# Altium project light.PrjPcb
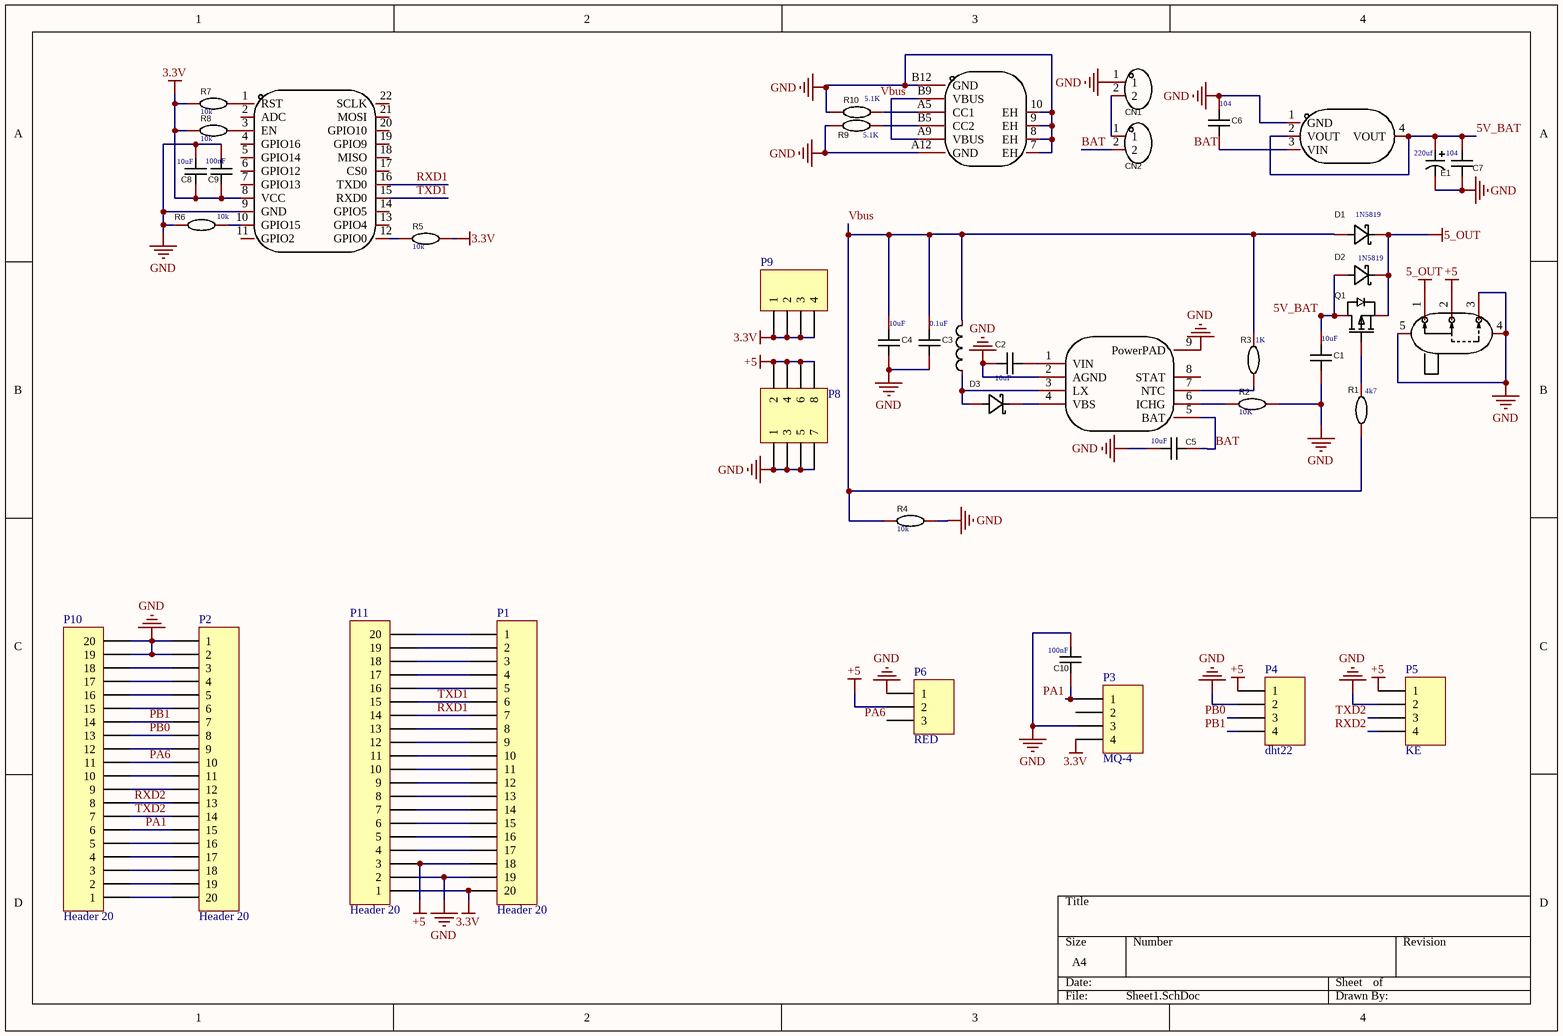
[diagram p0: Sheet1.SchDoc]
1 sheet, 43 parts. Net scope: global (net labels, ports and power ports of the same name join across sheets).
Board file: PCB1.PcbDoc

## Sheet Sheet1.SchDoc
size A4

### Parts
C1  10uF  [C0402]
C2  10uF  [C0402]
C3  0.1uF  [C0402]
C4  10uF  [C0402]
C5  10uF  [C0402]
C6  104  [C0402]
C7  104  [C0402]
C8  10uF  [C0402]
C9  100nF  [C0402]
C10  100nF  [C0402]
CN1  ZX-XH2.54-2PZZ  [CONN-TH_2P-P2.50_HX25003-2A]  (value not drawn)
CN2  ZX-XH2.54-2PZZ  [CONN-TH_2P-P2.50_HX25003-2A]  (value not drawn)
D1  1N5819  [SOD-323_L1.6-W1.3-LS2.7-RD]
D2  1N5819  [SOD-323_L1.6-W1.3-LS2.7-RD]
D3  1N5819WS S4_C2927280  [SOD-323_L1.6-W1.3-LS2.7-RD]  (value not drawn)
E1  220uf  [CAP-SMD_BD6.3-L6.6-W6.6-FD]
E3  XR0630-100M  [IND-SMD_L7.0-W6.6]  (value not drawn)
P1  Header 20  [HDR1X20]
P2  Header 20  [HDR1X20]
P3  MQ-4  [HDR1X4]
P4  dht22  [HDR1X4]
P5  KE  [HDR1X4]
P6  RED  [HDR1X3]
P8  Header 4X2  [HDR2X4]  (value not drawn)
P9  Header 4  [HDR1X4]  (value not drawn)
P10  Header 20  [HDR1X20]
P11  Header 20  [HDR1X20]
Q1  AO3401A_C15127  [SOT-23_L2.9-W1.3-P1.90-LS2.4-BR]  (value not drawn)
R1  4k7  [R0402]
R2  10K  [R0402]
R3  1K  [R0402]
R4  10k  [R0402]
R5  10k  [R0402]
R6  10k  [R0402]
R7  10k  [R0402]
R8  10k  [R0402]
R9  5.1K  [R0402]
R10  5.1K  [R0402]
U1  TPS5430DDAR  [ESOP-8_L4.9-W3.9-P1.27-LS6.0-TL-EP]  (value not drawn)
U3  AMS1117-5.0_C6187  [SOT-223_L6.5-W3.5-P2.30-LS7.0-BR]  (value not drawn)
U4  ESP-12F(ESP8266MOD)  [WIFIM-SMD_ESP-12F-ESP8266MOD]  (value not drawn)
USB1  U262-061N-4BVC11  [USB-SMD_U262-061N-4BVC11]  (value not drawn)
开关  SS-12F23-G4  [SW-TH_SS-12F23-G040]  (value not drawn)

### Nets
3.3V: C8.1 C9.1 P1.20 P3.4 P9.1 P9.2 P9.3 P9.4 P11.1 R5.1 R7.2 R8.2 U4.8(VCC)
5_OUT: D1.1(C) D2.1(C) Q1.2(S) 开关.1
+5: P1.18 P4.1 P5.1 P6.2 P8.2 P8.4 P8.6 P8.8 P11.3 开关.2
GND: C1.1 C2.2 C3.1 C4.1 C5.2 C6.2 C7.1 C8.2 C9.2 C10.2 CN1.1 E1.2 P1.19 P2.1 P2.2 P3.3 P4.2 P5.2 P6.1 P8.1 P8.3 P8.5 P8.7 P10.19 P10.20 P11.2 R2.1 R4.2 R6.2 R9.2 R10.2 U1.2(AGND) U1.9(PowerPAD) U3.1(GND) U4.9(GND) USB1.7(EH) USB1.8(EH) USB1.9(EH) USB1.10(EH) USB1.A12(GND) USB1.B12(GND) 开关.3 开关.4 开关.5
5V_BAT: C1.2 C7.2 D2.2(A) E1.1 Q1.3(D) U3.2(VOUT) U3.4(VOUT)
BAT: C5.1 C6.1 CN2.2 U1.5(BAT) U3.3(VIN)
PA1: C10.1 P2.15 P3.1 P10.6
PA6: P2.10 P6.3 P10.11
PB0: P2.8 P4.3 P10.13
PB1: P2.7 P4.4 P10.14
RXD1: P1.7 P11.14 U4.16(TXD0)
RXD2: P2.13 P5.4 P10.8
TXD1: P1.6 P11.15 U4.15(RXD0)
TXD2: P2.14 P5.3 P10.7
Vbus: C3.2 C4.2 D1.2(A) E3.2 R1.1 R3.2 R4.1 USB1.A9(VBUS) USB1.B9(VBUS)
NetC2_1: C2.1 U1.1(VIN)
NetCN1_2: CN1.2 CN2.1
NetD3_1: D3.1(C) U1.4(VBS)
NetD3_2: D3.2(A) E3.1 U1.3(LX)
NetP1_1: P1.1 P11.20
NetP1_2: P1.2 P11.19
NetP1_3: P1.3 P11.18
NetP1_4: P1.4 P11.17
NetP1_5: P1.5 P11.16
NetP1_8: P1.8 P11.13
NetP1_9: P1.9 P11.12
NetP1_10: P1.10 P11.11
NetP1_11: P1.11 P11.10
NetP1_12: P1.12 P11.9
NetP1_13: P1.13 P11.8
NetP1_14: P1.14 P11.7
NetP1_15: P1.15 P11.6
NetP1_16: P1.16 P11.5
NetP1_17: P1.17 P11.4
NetP2_3: P2.3 P10.18
NetP2_4: P2.4 P10.17
NetP2_5: P2.5 P10.16
NetP2_6: P2.6 P10.15
NetP2_9: P2.9 P10.12
NetP2_11: P2.11 P10.10
NetP2_12: P2.12 P10.9
NetP2_16: P2.16 P10.5
NetP2_17: P2.17 P10.4
NetP2_18: P2.18 P10.3
NetP2_19: P2.19 P10.2
NetP2_20: P2.20 P10.1
NetQ1_1: Q1.1(G) R1.2
NetR2_2: R2.2 U1.6(ICHG)
NetR3_1: R3.1 U1.7(NTC)
NetR5_2: R5.2 U4.12(GPIO0)
NetR6_1: R6.1 U4.10(GPIO15)
NetR7_1: R7.1 U4.1(RST)
NetR8_1: R8.1 U4.3(EN)
NetR9_1: R9.1 USB1.B5(CC2)
NetR10_1: R10.1 USB1.A5(CC1)

Not connected (* = marked no-connect by the designer): P3 2; U1 8(STAT); U4 2(ADC) 4(GPIO16) 5(GPIO14) 6(GPIO12) 7(GPIO13) 11(GPIO2) 13(GPIO4) 14(GPIO5) 17(CS0) 18(MISO) 19(GPIO9) 20(GPIO10) 21(MOSI) 22(SCLK)

### Library data of the parts
C1-C8 = GRM155R71H104KE14D: Manufacturer: muRata(村田); Value: 100nF; Add into BOM: yes; Tolerance: ±10%; Voltage Rated: 50V; Temperature Coefficient: X7R; Symbol: GRM155R71H104KE14D; Device: GRM155R71H104KE14D; Supplier: LCSC; Manufacturer Part: GRM155R71H104KE14D; Supplier Part: C77020; JLCPCB Part Class: Extended Part; LCSC Part Name: 100nF ±10% 50V; Supplier Footprint: 0402; Datasheet: https://atta.szlcsc.com/upload/public/pdf/source/20180326/C77020_39BD49C951FF1AF0DB1F1FAC5AC1E401.pdf; Convert to PCB: yes
C9 C10 = GRM155R71H104KE14D: Manufacturer: muRata(村田); Add into BOM: yes; Tolerance: ±10%; Voltage Rated: 50V; Temperature Coefficient: X7R; Symbol: GRM155R71H104KE14D; Device: GRM155R71H104KE14D; Supplier: LCSC; Manufacturer Part: GRM155R71H104KE14D; Value: 100nF; Supplier Part: C77020; JLCPCB Part Class: Extended Part; LCSC Part Name: 100nF ±10% 50V; Supplier Footprint: 0402; Datasheet: https://atta.szlcsc.com/upload/public/pdf/source/20180326/C77020_39BD49C951FF1AF0DB1F1FAC5AC1E401.pdf; Convert to PCB: yes
CN1 CN2 = ZX-XH2.54-2PZZ: Manufacturer: Megastar(兆星); Add into BOM: yes; Pins Structure: 1x2P; Pitch: 2.54mm; Reference Series: XH; Number of PINs Per Row: 2; Current Rating (Max): 3A; Symbol: ZX-XH2.54-2PZZ; Device: ZX-XH2.54-2PZZ; Supplier: LCSC; Supplier Part: C7429632; Manufacturer Part: ZX-XH2.54-2PZZ; JLCPCB Part Class: Extended Part; LCSC Part Name: ZX-XH2.54-2PZZ; Supplier Footprint: 插件,P=2.54mm; Datasheet: https://atta.szlcsc.com/upload/public/pdf/source/20230619/19BA6947230AA44A04D3EDD65E618FD0.pdf; Convert to PCB: yes; Mounting Style: 直插; Number of Pins: 2P; Number of Rows: 1; Row Spacing: -; Contact Material: 黄铜; Contact Plating: 锡; Operating Temperature Range: -25℃~+85℃
D1-D3 = 1N5819WS S4_C2927280: Manufacturer: JSMSEMI(杰盛微); Add into BOM: yes; Diode Configuration: 独立式; Forward Voltage (Vf@If): 600mV@200mA; Reverse Voltage (Vr): 40V; Average Rectified Current (Io): 350mA; Reverse Leakage Current (Ir): 5uA@30V; Symbol: 1N5819WS S4; Device: 1N5819WS S4_C2927280; LCSC Part Name: 电压:40V 电流:350mA; Supplier Part: C2927280; Manufacturer Part: 1N5819WS S4; Supplier Footprint: SOD-323; JLCPCB Part Class: Extended Part; Datasheet: https://atta.szlcsc.com/upload/public/pdf/source/20240105/574E572B69D2DF1CD36E5C05FAB269C4.pdf; Supplier: LCSC; Convert to PCB: yes
E1 = RST220UF10V018: Manufacturer: KNSCHA(科尼盛); Add into BOM: yes; Tolerance: ±20%; Rated Voltage: 10V; Ripple Current: 85mA@120Hz; φD: 6.3mm; L: 5.4mm; Lifetime @ Temp: 2000hrs@105℃; Symbol: RST220UF10V018; Device: RST220UF10V018; LCSC Part Name: 220uF ±20% 10V; Supplier Part: C4747973; Manufacturer Part: RST220UF10V018; Supplier Footprint: SMD,D6.3xL5.4mm; JLCPCB Part Class: Extended Part; Datasheet: https://atta.szlcsc.com/upload/public/pdf/source/20220722/AD247F0826B90D1CD53BDFA96956336C.pdf; Supplier: LCSC; Convert to PCB: yes; Value: 220uF; Equivalent Series Resistance(ESR): -; Operating Temperature: -40℃~+105℃
E3 = XR0630-100M: Manufacturer: XR(祥如); Add into BOM: yes; Value: 10uH; Tolerance: ±20%; Rated Current: 4.5A; Saturation Current (Isat): 5.5A; DC Resistance (DCR): 68mΩ; Symbol: XR0630-100M; Device: XR0630-100M; LCSC Part Name: 10uH ±20% 5.5A; Supplier Part: C5307622; Manufacturer Part: XR0630-100M; Supplier Footprint: SMD,0630; JLCPCB Part Class: Extended Part; Datasheet: https://atta.szlcsc.com/upload/public/pdf/source/20240328/FF0C10B64CBAAE6FA647F96E85C1BA7B.pdf; Supplier: LCSC; Convert to PCB: yes; Type: 一体成型电感
P1 P2 P10 P11 = Header 20: Header, 20-Pin; LatestRevisionDate: 17-Jul-2002; LatestRevisionNote: Re-released for DXP Platform.; Publisher: Altium Limited
P3-P5 P9 = Header 4: Header, 4-Pin; LatestRevisionDate: 17-Jul-2002; LatestRevisionNote: Re-released for DXP Platform.; Publisher: Altium Limited
P6 = Header 3: Header, 3-Pin; LatestRevisionDate: 17-Jul-2002; LatestRevisionNote: Re-released for DXP Platform.; Publisher: Altium Limited
P8 = Header 4X2: Header, 4-Pin, Dual row; LatestRevisionDate: 17-Jul-2002; LatestRevisionNote: Re-released for DXP Platform.; Publisher: Altium Limited
Q1 = AO3401A_C15127: Manufacturer: AOS; Add into BOM: yes; Type: 1个P沟道; Drain Source Voltage (Vdss): 30V; Continuous Drain Current (Id): 4A; Power Dissipation (Pd): 1.4W; Drain Source On Resistance (RDS(on)@Vgs,Id): 44mΩ@10V,4.3A; Gate Threshold Voltage (Vgs(th)@Id): 1.3V@250uA; Total Gate Charge (Qg@Vgs): 12.2nC@4.5V; Input Capacitance (Ciss@Vds): 1.2nF@15V; Symbol: AO3401A; Device: AO3401A_C15127; LCSC Part Name: 1个P沟道 耐压:30V 电流:4A; Supplier Part: C15127; Manufacturer Part: AO3401A; Supplier Footprint: SOT-23; JLCPCB Part Class: Basic Part; Datasheet: https://atta.szlcsc.com/upload/public/pdf/source/20160507/1462613609053.pdf; Supplier: LCSC; Convert to PCB: yes; Operating Temperature: -55℃~+150℃@(Tj)
R1-R10 = 0402WGF1001TCE: Manufacturer: UNI-ROYAL(厚声); Value: 1kΩ; Add into BOM: yes; Tolerance: ±1%; Power(Watts): 62.5mW; Overload Voltage (Max): 50V; Temperature Coefficient: ±100ppm/℃; Symbol: 0402WGF1001TCE; Device: 0402WGF1001TCE; Supplier: LCSC; Manufacturer Part: 0402WGF1001TCE; Supplier Part: C11702; JLCPCB Part Class: Basic Part; LCSC Part Name: 1kΩ ±1% 62.5mW 厚膜电阻; Supplier Footprint: 0402; Datasheet: https://atta.szlcsc.com/upload/public/pdf/source/20200306/C422600_1E6D84923E4A46A82E41ADD87F860B5C.pdf; Convert to PCB: yes; Type: 厚膜电阻; Operating Temperature Range: -55℃~+155℃
U1 = CS5090E: Manufacturer: TI(德州仪器); Add into BOM: yes; Function: 降压型; Output Type: 可调; Input Voltage: 5.5V~36V; Output Voltage: 1.221V~32.04V; Output Current (Max): 3A; Switching Frequency: 500kHz; Synchronous Rectification: 否; Number of Outputs: 1; Topology: 降压式; Switch tube (built-in/external): 内置; Symbol: TPS5430DDAR; Device: TPS5430DDAR; LCSC Part Name: 降压 3A 36V; Supplier Part: C9864; Manufacturer Part: TPS5430DDAR; Supplier Footprint: SOIC-8-EP; JLCPCB Part Class: Basic Part; Datasheet: https://www.ti.com/cn/lit/gpn/tps5430; Supplier: LCSC; Convert to PCB: yes; Operating Temperature: -40℃~+125℃@(TJ)
U3 = AMS1117-5.0_C6187: Manufacturer: AMS; Add into BOM: yes; Output Type: 固定; Maximum Input Voltage: 12V; Output Voltage: 5V; MAX Output Current: 1A; Power Supply Rejection Ratio (PSRR): 68dB@(120Hz); Dropout Voltage: 1.3V@(1A); Output Polarity: 正极; Number of Outputs: 1; Symbol: AMS1117-5.0; Device: AMS1117-5.0_C6187; Supplier: LCSC; Manufacturer Part: AMS1117-5.0; Supplier Part: C6187; JLCPCB Part Class: Basic Part; LCSC Part Name: 输入12V 输出5V 1A; Supplier Footprint: SOT-223; Datasheet: https://atta.szlcsc.com/upload/public/pdf/source/20230918/E4B716057EE82179D88E8A0894830D59.pdf; Convert to PCB: yes; standby current: -; Noise: -; Feature: -; Operating Temperature: -
U4 = ESP-12F(ESP8266MOD): Manufacturer: Ai-Thinker(安信可); Add into BOM: yes; Core Processor: ESP8266芯片; Support Interface: GPIO；UART；I2C；PWM；SPI；ADC; Value: 2.4GHz; Antenna Type: 板载PCB天线; Output Power: 16dBm; Operating Voltage: 3.3V; Receive  Current: 120mA; Send  Current: 170mA; Sensitivity: -90dBm; Symbol: ESP-12F(ESP8266MOD); Device: ESP-12F(ESP8266MOD); LCSC Part Name: 完整的802.11b/g/nWi-FiSoC模块; Supplier Part: C82891; Manufacturer Part: ESP-12F(ESP8266MOD); Supplier Footprint: SMD,16x24mm; JLCPCB Part Class: Extended Part; Datasheet: https://atta.szlcsc.com/upload/public/pdf/source/20210219/C82891_ABD84A460F4F056A2757267CCCA4B508.pdf; Supplier: LCSC; Convert to PCB: yes; Wireless Standard: -; Operating Temperature: -40℃~+85℃
USB1 = U262-061N-4BVC11: Manufacturer: XKB Connection(中国星坤); Add into BOM: yes; Connector Type: Type-C; Gender: 母; Number of Ports: 1; Number of Contacts: 6P; Current Rating - Power (Max): 5A; Soldering Temperature(Max): 260℃; Symbol: U262-061N-4BVC11; Device: U262-061N-4BVC11; LCSC Part Name: Type-C 母 卧贴; Supplier Part: C2764612; Manufacturer Part: U262-061N-4BVC11; Supplier Footprint: SMD; JLCPCB Part Class: Extended Part; Datasheet: https://atta.szlcsc.com/upload/public/pdf/source/20210602/C2764612_915BA3D27A0B76A9D989108E3A082B29.pdf; Supplier: LCSC; Convert to PCB: yes; Standard: USB 3.1; Mounting Style: 卧贴; Contact Material: 铜合金; Contact Plating: 金; Operating Temperature Range: -25℃~+85℃
开关 = SS-12F23-G4: Manufacturer: DEALON(德艺隆); Add into BOM: yes; Circuit: 单刀双掷; Actuator Style: 矩形柱状; Pin Style: PC引脚; Switch Length: 13mm; Switch Width: 5.8mm; Switch Height: 9mm; Actuator Color: 黑色; Symbol: SS-12F23-G4; Device: SS-12F23-G4; LCSC Part Name: 拨动开关; Supplier Part: C2998806; Manufacturer Part: SS-12F23-G4; Supplier Footprint: 插件; JLCPCB Part Class: Extended Part; Datasheet: https://atta.szlcsc.com/upload/public/pdf/source/20220428/B341684C4335C21BC408331FBC341DAE.pdf; Supplier: LCSC; Convert to PCB: yes; Mounting Style: 侧插; Mechanical Life: -